# Altium schematic sheet AD9361.SchDoc
size A4; SheetNumber: 7; SheetTotal: 11
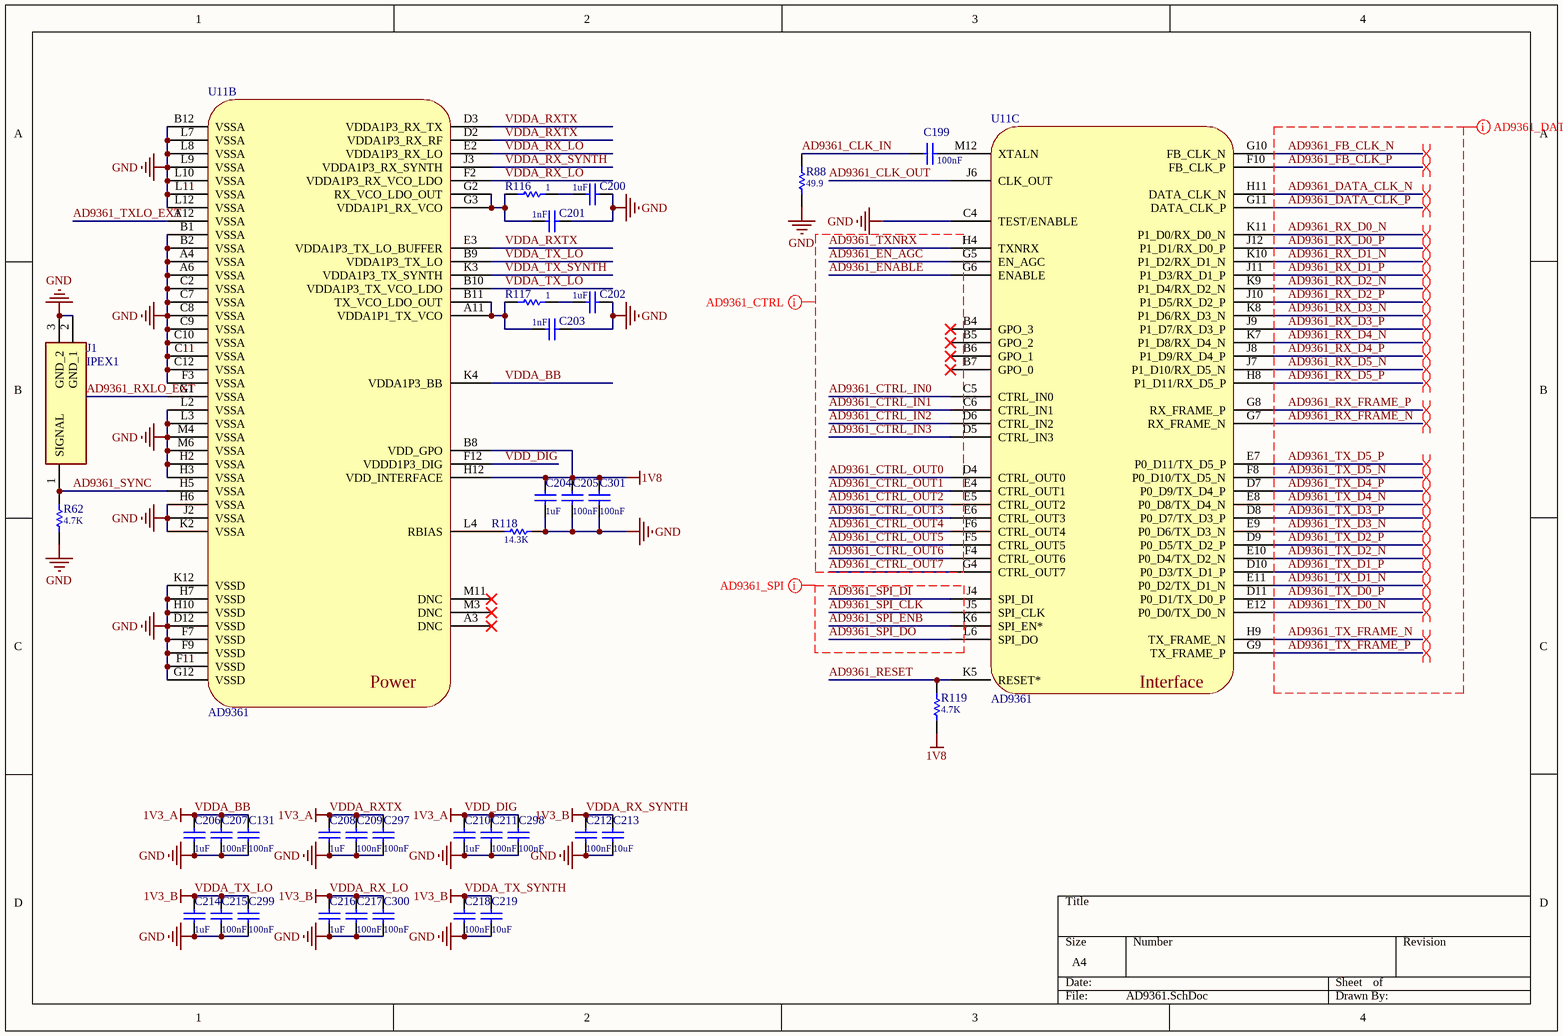
[diagram p0: AD9361.SchDoc]

## Parts
C131  value 100nF  [C0402-L]  (hidden comment: Cap-S)
C199  value 100nF  [C0402-L]  (hidden comment: Cap-S)
C200  value 1uF  [C0402-L]  (hidden comment: Cap-S)
C201  value 1nF  [C0402-L]  (hidden comment: Cap-S)
C202  value 1uF  [C0402-L]  (hidden comment: Cap-S)
C203  value 1nF  [C0402-L]  (hidden comment: Cap-S)
C204  value 1uF  [C0402-L]  (hidden comment: Cap-S)
C205  value 100nF  [C0402-L]  (hidden comment: Cap-S)
C206  value 1uF  [C0402-L]  (hidden comment: Cap-S)
C207  value 100nF  [C0402-L]  (hidden comment: Cap-S)
C208  value 1uF  [C0402-L]  (hidden comment: Cap-S)
C209  value 100nF  [C0402-L]  (hidden comment: Cap-S)
C210  value 1uF  [C0402-L]  (hidden comment: Cap-S)
C211  value 100nF  [C0402-L]  (hidden comment: Cap-S)
C212  value 100nF  [C0402-L]  (hidden comment: Cap-S)
C213  value 10uF  [C0603-L]  (hidden comment: Cap-S)
C214  value 1uF  [C0402-L]  (hidden comment: Cap-S)
C215  value 100nF  [C0402-L]  (hidden comment: Cap-S)
C216  value 1uF  [C0402-L]  (hidden comment: Cap-S)
C217  value 100nF  [C0402-L]  (hidden comment: Cap-S)
C218  value 100nF  [C0402-L]  (hidden comment: Cap-S)
C219  value 10uF  [C0603-L]  (hidden comment: Cap-S)
C297  value 100nF  [C0402-L]  (hidden comment: Cap-S)
C298  value 100nF  [C0402-L]  (hidden comment: Cap-S)
C299  value 100nF  [C0402-L]  (hidden comment: Cap-S)
C300  value 100nF  [C0402-L]  (hidden comment: Cap-S)
C301  value 100nF  [C0402-L]  (hidden comment: Cap-S)
J1  IPEX1  [20279-001E]
R62  value 4.7K  [R0402-L]  (hidden comment: R)
R88  value 49.9  [R0402-L]  (hidden comment: R)
R116  value 1  [R0402-L]  (hidden comment: R)
R117  value 1  [R0402-L]  (hidden comment: R)
R118  value 14.3K  [R0402-L]  (hidden comment: R)
R119  value 4.7K  [R0402-L]  (hidden comment: R)
U11  AD9361  [BGA144C80P12X12_1000X1000X170]  (parts B,C of 3)

## Nets
1V8: C204.2 C205.2 C301.2 R119.2 U11.B8(VDD_GPO) U11.H12(VDD_INTERFACE)
GND: C131.1 C200.1 C201.1 C202.1 C203.1 C204.1 C205.1 C206.1 C207.1 C208.1 C209.1 C210.1 C211.1 C212.1 C213.1 C214.1 C215.1 C216.1 C217.1 C218.1 C219.1 C297.1 C298.1 C299.1 C300.1 C301.1 J1.2(GND_1) J1.3(GND_2) R62.2 R88.1 R118.2 U11.A4(VSSA) U11.A6(VSSA) U11.B1(VSSA) U11.B2(VSSA) U11.B12(VSSA) U11.C2(VSSA) U11.C4(TEST/ENABLE) U11.C7(VSSA) U11.C8(VSSA) U11.C9(VSSA) U11.C10(VSSA) U11.C11(VSSA) U11.C12(VSSA) U11.D12(VSSD) U11.F3(VSSA) U11.F7(VSSD) U11.F9(VSSD) U11.F11(VSSD) U11.G12(VSSD) U11.H2(VSSA) U11.H3(VSSA) U11.H6(VSSA) U11.H7(VSSD) U11.H10(VSSD) U11.J2(VSSA) U11.K2(VSSA) U11.K12(VSSD) U11.L2(VSSA) U11.L3(VSSA) U11.L7(VSSA) U11.L8(VSSA) U11.L9(VSSA) U11.L10(VSSA) U11.L11(VSSA) U11.L12(VSSA) U11.M4(VSSA) U11.M6(VSSA)
VDD_DIG: C131.2 C206.2 C207.2 C208.2 C209.2 C210.2 C211.2 C297.2 C298.2 U11.D2(VDDA1P3_RX_RF) U11.D3(VDDA1P3_RX_TX) U11.E3(VDDA1P3_TX_LO_BUFFER) U11.F12(VDDD1P3_DIG) U11.K4(VDDA1P3_BB)  [also labelled 1V3_A, VDDA_BB, VDDA_RXTX]
VDDA_RX_LO: C212.2 C213.2 C214.2 C215.2 C216.2 C217.2 C218.2 C219.2 C299.2 C300.2 U11.B9(VDDA1P3_TX_LO) U11.B10(VDDA1P3_TX_VCO_LDO) U11.E2(VDDA1P3_RX_LO) U11.F2(VDDA1P3_RX_VCO_LDO) U11.J3(VDDA1P3_RX_SYNTH) U11.K3(VDDA1P3_TX_SYNTH)  [also labelled 1V3_B, VDDA_RX_SYNTH, VDDA_TX_LO, VDDA_TX_SYNTH]
AD9361_CLK_IN: C199.2 R88.2
AD9361_CLK_OUT: U11.J6(CLK_OUT)
AD9361_CTRL_IN0: U11.C5(CTRL_IN0)
AD9361_CTRL_IN1: U11.C6(CTRL_IN1)
AD9361_CTRL_IN2: U11.D6(CTRL_IN2)
AD9361_CTRL_IN3: U11.D5(CTRL_IN3)
AD9361_CTRL_OUT0: U11.D4(CTRL_OUT0)
AD9361_CTRL_OUT1: U11.E4(CTRL_OUT1)
AD9361_CTRL_OUT2: U11.E5(CTRL_OUT2)
AD9361_CTRL_OUT3: U11.E6(CTRL_OUT3)
AD9361_CTRL_OUT4: U11.F6(CTRL_OUT4)
AD9361_CTRL_OUT5: U11.F5(CTRL_OUT5)
AD9361_CTRL_OUT6: U11.F4(CTRL_OUT6)
AD9361_CTRL_OUT7: U11.G4(CTRL_OUT7)
AD9361_DATA_CLK_N: U11.H11(DATA_CLK_N)
AD9361_DATA_CLK_P: U11.G11(DATA_CLK_P)
AD9361_EN_AGC: U11.G5(EN_AGC)
AD9361_ENABLE: U11.G6(ENABLE)
AD9361_FB_CLK_N: U11.G10(FB_CLK_N)
AD9361_FB_CLK_P: U11.F10(FB_CLK_P)
AD9361_RESET: R119.1 U11.K5(RESET*)
AD9361_RX_D0_N: U11.K11(P1_D0/RX_D0_N)
AD9361_RX_D0_P: U11.J12(P1_D1/RX_D0_P)
AD9361_RX_D1_N: U11.K10(P1_D2/RX_D1_N)
AD9361_RX_D1_P: U11.J11(P1_D3/RX_D1_P)
AD9361_RX_D2_N: U11.K9(P1_D4/RX_D2_N)
AD9361_RX_D2_P: U11.J10(P1_D5/RX_D2_P)
AD9361_RX_D3_N: U11.K8(P1_D6/RX_D3_N)
AD9361_RX_D3_P: U11.J9(P1_D7/RX_D3_P)
AD9361_RX_D4_N: U11.K7(P1_D8/RX_D4_N)
AD9361_RX_D4_P: U11.J8(P1_D9/RX_D4_P)
AD9361_RX_D5_N: U11.J7(P1_D10/RX_D5_N)
AD9361_RX_D5_P: U11.H8(P1_D11/RX_D5_P)
AD9361_RX_FRAME_N: U11.G7(RX_FRAME_N)
AD9361_RX_FRAME_P: U11.G8(RX_FRAME_P)
AD9361_RXLO_EXT: U11.G1(VSSA)
AD9361_SPI_CLK: U11.J5(SPI_CLK)
AD9361_SPI_DI: U11.J4(SPI_DI)
AD9361_SPI_DO: U11.L6(SPI_DO)
AD9361_SPI_ENB: U11.K6(SPI_EN*)
AD9361_SYNC: J1.1(SIGNAL) R62.1 U11.H5(VSSA)
AD9361_TX_D0_N: U11.E12(P0_D0/TX_D0_N)
AD9361_TX_D0_P: U11.D11(P0_D1/TX_D0_P)
AD9361_TX_D1_N: U11.E11(P0_D2/TX_D1_N)
AD9361_TX_D1_P: U11.D10(P0_D3/TX_D1_P)
AD9361_TX_D2_N: U11.E10(P0_D4/TX_D2_N)
AD9361_TX_D2_P: U11.D9(P0_D5/TX_D2_P)
AD9361_TX_D3_N: U11.E9(P0_D6/TX_D3_N)
AD9361_TX_D3_P: U11.D8(P0_D7/TX_D3_P)
AD9361_TX_D4_N: U11.E8(P0_D8/TX_D4_N)
AD9361_TX_D4_P: U11.D7(P0_D9/TX_D4_P)
AD9361_TX_D5_N: U11.F8(P0_D10/TX_D5_N)
AD9361_TX_D5_P: U11.E7(P0_D11/TX_D5_P)
AD9361_TX_FRAME_N: U11.H9(TX_FRAME_N)
AD9361_TX_FRAME_P: U11.G9(TX_FRAME_P)
AD9361_TXLO_EXT: U11.A12(VSSA)
AD9361_TXNRX: U11.H4(TXNRX)
NetC199_1: C199.1 U11.M12(XTALN)
NetC200_2: C200.2 R116.2
NetC201_2: C201.2 R116.1 U11.G2(RX_VCO_LDO_OUT) U11.G3(VDDA1P1_RX_VCO)
NetC202_2: C202.2 R117.2
NetC203_2: C203.2 R117.1 U11.A11(VDDA1P1_TX_VCO) U11.B11(TX_VCO_LDO_OUT)
NetR118_1: R118.1 U11.L4(RBIAS)

Not connected (* = marked no-connect by the designer): U11 A3(DNC)* B4(GPO_3)* B5(GPO_2)* B6(GPO_1)* B7(GPO_0)* M3(DNC)* M11(DNC)*

## Layout directives
differential pair: AD9361_DATA_CLK_N, AD9361_DATA_CLK_P, AD9361_FB_CLK_N, AD9361_FB_CLK_P, AD9361_RX_D0_N, AD9361_RX_D0_P, AD9361_RX_D1_N, AD9361_RX_D1_P, AD9361_RX_D2_N, AD9361_RX_D2_P, AD9361_RX_D3_N, AD9361_RX_D3_P, AD9361_RX_D4_N, AD9361_RX_D4_P, AD9361_RX_D5_N, AD9361_RX_D5_P, AD9361_RX_FRAME_N, AD9361_RX_FRAME_P, AD9361_TX_D0_N, AD9361_TX_D0_P, AD9361_TX_D1_N, AD9361_TX_D1_P, AD9361_TX_D2_N, AD9361_TX_D2_P, AD9361_TX_D3_N, AD9361_TX_D3_P, AD9361_TX_D4_N, AD9361_TX_D4_P, AD9361_TX_D5_N, AD9361_TX_D5_P, AD9361_TX_FRAME_N, AD9361_TX_FRAME_P
net class AD9361_DATA: AD9361_DATA_CLK_N, AD9361_DATA_CLK_P, AD9361_FB_CLK_N, AD9361_FB_CLK_P, AD9361_RX_D0_N, AD9361_RX_D0_P, AD9361_RX_D1_N, AD9361_RX_D1_P, AD9361_RX_D2_N, AD9361_RX_D2_P, AD9361_RX_D3_N, AD9361_RX_D3_P, AD9361_RX_D4_N, AD9361_RX_D4_P, AD9361_RX_D5_N, AD9361_RX_D5_P, AD9361_RX_FRAME_N, AD9361_RX_FRAME_P, AD9361_TX_D0_N, AD9361_TX_D0_P, AD9361_TX_D1_N, AD9361_TX_D1_P, AD9361_TX_D2_N, AD9361_TX_D2_P, AD9361_TX_D3_N, AD9361_TX_D3_P, AD9361_TX_D4_N, AD9361_TX_D4_P, AD9361_TX_D5_N, AD9361_TX_D5_P, AD9361_TX_FRAME_N, AD9361_TX_FRAME_P
net class AD9361_SPI: AD9361_SPI_CLK, AD9361_SPI_DI, AD9361_SPI_DO, AD9361_SPI_ENB
net class AD9361_CTRL: AD9361_CTRL_IN0, AD9361_CTRL_IN1, AD9361_CTRL_IN2, AD9361_CTRL_IN3, AD9361_CTRL_OUT0, AD9361_CTRL_OUT1, AD9361_CTRL_OUT2, AD9361_CTRL_OUT3, AD9361_CTRL_OUT4, AD9361_CTRL_OUT5, AD9361_CTRL_OUT6, AD9361_CTRL_OUT7, AD9361_EN_AGC, AD9361_ENABLE, AD9361_TXNRX

## Notes on the sheet
- (in symbol AD9361, part B) Power
- (in symbol AD9361, part C) Interface

## Library data of the parts
C131 C199-C219 C297-C301 = Cap-S: 贴片瓷片电容
J1 = IPEX4
R62 R88 R116-R119 = Res: 贴片电阻
U11 = AD9361: 70M-6G射频收发器